# Altium schematic sheet 6.音频_FAN_ADC_LED.SchDoc
size 420 x 297 mm; SheetNumber: 6; SheetTotal: 13
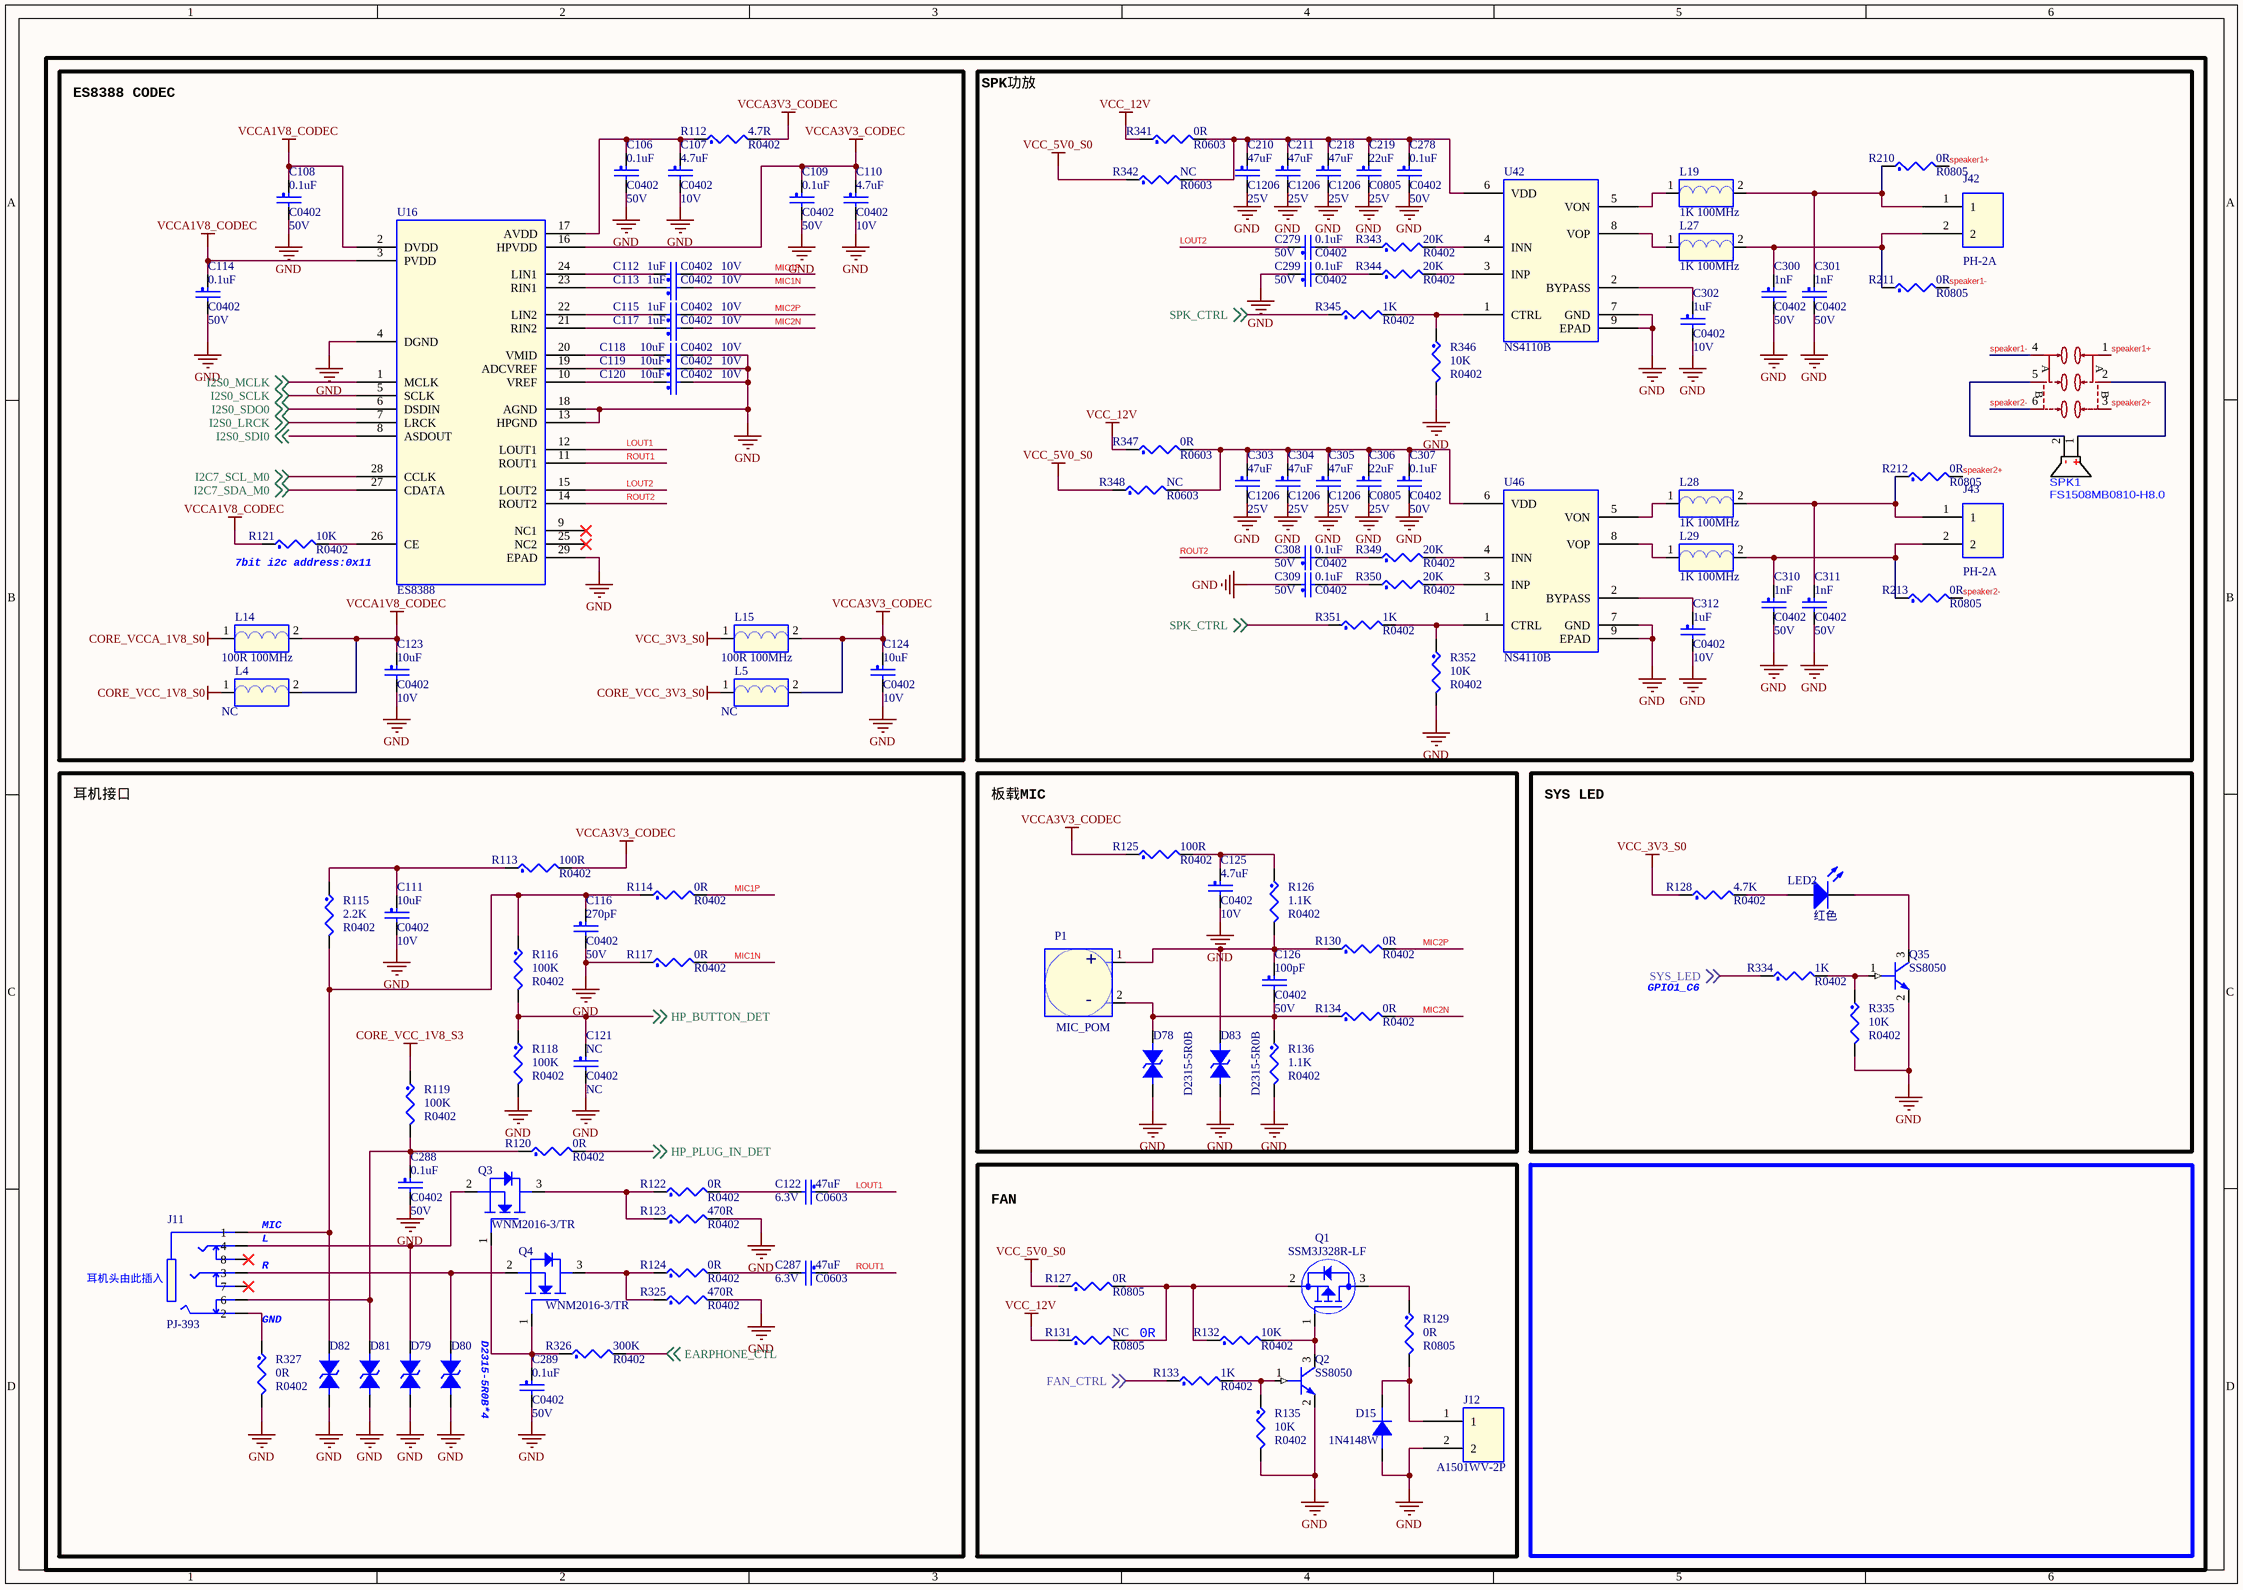
[diagram p0: 6.音频_FAN_ADC_LED.SchDoc]

## Parts
C106  0.1uF  Voltage: 50V  [C0402]
C107  4.7uF  Voltage: 10V  [C0402]
C108  0.1uF  Voltage: 50V  [C0402]
C109  0.1uF  Voltage: 50V  [C0402]
C110  4.7uF  Voltage: 10V  [C0402]
C111  10uF  Voltage: 10V  [C0402]
C112  1uF  Voltage: 10V  [C0402]
C113  1uF  Voltage: 10V  [C0402]
C114  0.1uF  Voltage: 50V  [C0402]
C115  1uF  Voltage: 10V  [C0402]
C116  270pF  Voltage: 50V  [C0402]
C117  1uF  Voltage: 10V  [C0402]
C118  10uF  Voltage: 10V  [C0402]
C119  10uF  Voltage: 10V  [C0402]
C120  10uF  Voltage: 10V  [C0402]
C121  NC  [C0402]
C122  47uF  Voltage: 6.3V  [C0603]
C123  10uF  Voltage: 10V  [C0402]
C124  10uF  Voltage: 10V  [C0402]
C125  4.7uF  Voltage: 10V  [C0402]
C126  100pF  Voltage: 50V  [C0402]
C210  47uF  Voltage: 25V  [C1206]
C211  47uF  Voltage: 25V  [C1206]
C218  47uF  Voltage: 25V  [C1206]
C219  22uF  Voltage: 25V  [C0805]
C278  0.1uF  Voltage: 50V  [C0402]
C279  0.1uF  Voltage: 50V  [C0402]
C287  47uF  Voltage: 6.3V  [C0603]
C288  0.1uF  Voltage: 50V  [C0402]
C289  0.1uF  Voltage: 50V  [C0402]
C299  0.1uF  Voltage: 50V  [C0402]
C300  1nF  Voltage: 50V  [C0402]
C301  1nF  Voltage: 50V  [C0402]
C302  1uF  Voltage: 10V  [C0402]
C303  47uF  Voltage: 25V  [C1206]
C304  47uF  Voltage: 25V  [C1206]
C305  47uF  Voltage: 25V  [C1206]
C306  22uF  Voltage: 25V  [C0805]
C307  0.1uF  Voltage: 50V  [C0402]
C308  0.1uF  Voltage: 50V  [C0402]
C309  0.1uF  Voltage: 50V  [C0402]
C310  1nF  Voltage: 50V  [C0402]
C311  1nF  Voltage: 50V  [C0402]
C312  1uF  Voltage: 10V  [C0402]
D15  1N4148W  [SOD-123]
D78  D2315-5R0B  [esd0402]
D79  D2315-5R0B  [esd0402]  (value not drawn)
D80  D2315-5R0B  [esd0402]  (value not drawn)
D81  D2315-5R0B  [esd0402]  (value not drawn)
D82  D2315-5R0B  [esd0402]  (value not drawn)
D83  D2315-5R0B  [esd0402]
J11  PJ-393  [audio_smd_7p_6r0x8r8]
J12  A1501WV-2P  [zh1p5mm_th_2p]
J42  PH-2A  [PH-1x2-2P0_l]
J43  PH-2A  [PH-1x2-2P0_l]
L4  NC  [L0603]
L5  NC  [L0603]
L14  100R 100MHz  [L0603]
L15  100R 100MHz  [L0603]
L19  1K 100MHz  [L0603]
L27  1K 100MHz  [L0603]
L28  1K 100MHz  [L0603]
L29  1K 100MHz  [L0603]
LED2  红色  [LED0603_R]
P1  MIC_POM  [MIC2-4R00-TM]
Q1  SSM3J328R-LF  [SOT23]
Q2  SS8050  [SOT23]
Q3  WNM2016-3/TR  [SOT23]
Q4  WNM2016-3/TR  [SOT23]
Q35  SS8050  [SOT23]
R112  4.7R  [R0402]
R113  100R  [R0402]
R114  0R  [R0402]
R115  2.2K  [R0402]
R116  100K  [R0402]
R117  0R  [R0402]
R118  100K  [R0402]
R119  100K  [R0402]
R120  0R  [R0402]
R121  10K  [R0402]
R122  0R  [R0402]
R123  470R  [R0402]
R124  0R  [R0402]
R125  100R  [R0402]
R126  1.1K  [R0402]
R127  0R  [R0805]
R128  4.7K  [R0402]
R129  0R  [R0805]
R130  0R  [R0402]
R131  NC  [R0805]
R132  10K  [R0402]
R133  1K  [R0402]
R134  0R  [R0402]
R135  10K  [R0402]
R136  1.1K  [R0402]
R210  0R  [R0805]
R211  0R  [R0805]
R212  0R  [R0805]
R213  0R  [R0805]
R325  470R  [R0402]
R326  300K  [R0402]
R327  0R  [R0402]
R334  1K  [R0402]
R335  10K  [R0402]
R341  0R  [R0603]
R342  NC  [R0603]
R343  20K  [R0402]
R344  20K  [R0402]
R345  1K  [R0402]
R346  10K  [R0402]
R347  0R  [R0603]
R348  NC  [R0603]
R349  20K  [R0402]
R350  20K  [R0402]
R351  1K  [R0402]
R352  10K  [R0402]
SPK1  FS1508MB0810-H8.0  [BEEP-TH_BD15.0-P10.20-D1.2]
SW5  MST22D18G2  [SW-SMD_MST22D18G2]  (value not drawn)
U16  ES8388  [qfn28_0r45-4x4EP2R6X2R6]
U42  NS4110B  [SOP-8-EP-2R5X3R4]
U46  NS4110B  [SOP-8-EP-2R5X3R4]

## Blocks framed on the sheet
ES8388 CODEC: C106-C110 C112-C115 C117-C120 C123 C124 L4 L5 L14 L15 R112 R121 U16
SPK功放: C210 C211 C218 C219 C278 C279 C299-C312 J42 J43 L19 L27-L29 R210-R213 R341-R352 SPK1 SW5 U42 U46
耳机接口: C111 C116 C121 C122 C287-C289 D79-D82 J11 Q3 Q4 R113-R120 R122-R124 R325-R327
板载MIC: C125 C126 D78 D83 P1 R125 R126 R130 R134 R136
SYS LED: LED2 Q35 R128 R334 R335
FAN: D15 J12 Q1 Q2 R127 R129 R131-R133 R135

## Nets
CORE_VCC_1V8_S0: L4.1
CORE_VCC_1V8_S3: R119.1
CORE_VCC_3V3_S0: L5.1
CORE_VCCA_1V8_S0: L14.1
GND: C106.2 C107.2 C108.2 C109.2 C110.2 C111.2 C114.2 C116.2 C118.2 C119.2 C120.2 C121.2 C123.2 C124.2 C125.2 C210.2 C211.2 C218.2 C219.2 C278.2 C288.2 C289.2 C299.1 C300.2 C301.2 C302.2 C303.2 C304.2 C305.2 C306.2 C307.2 C309.1 C310.2 C311.2 C312.2 D15.2(A) D78.1 D79.1 D80.1 D81.1 D82.1 D83.1 J12.2 Q2.2(EMITTER) Q35.2(EMITTER) R117.1 R118.2 R123.2 R135.2 R136.2 R325.2 R327.2 R335.2 R346.2 R352.2 U16.4(DGND) U16.13(HPGND) U16.18(AGND) U16.29(EPAD) U42.7(GND) U42.9(EPAD) U46.7(GND) U46.9(EPAD)
VCC_3V3_S0: L15.1 R128.1
VCC_5V0_S0: R127.1 R342.1 R348.1
VCC_12V: R131.1 R341.1 R347.1
VCCA1V8_CODEC: C108.1 C114.1 C123.1 L4.2 L14.2 R121.1 U16.2(DVDD) U16.3(PVDD)
VCCA3V3_CODEC: C109.1 C110.1 C124.1 L5.2 L15.2 R112.2 R113.2 R125.1 U16.16(HPVDD)
EARPHONE_CTL: R326.2 ; off-sheet EARPHONE_CTL
FAN_CTRL: R133.1 ; off-sheet FAN_CTRL
HP_BUTTON_DET: C121.1 R116.2 R118.1 ; off-sheet HP_BUTTON_DET
HP_PLUG_IN_DET: R120.2 ; off-sheet HP_PLUG_IN_DET
I2C7_SCL_M0: U16.28(CCLK) ; off-sheet I2C7_SCL_M0
I2C7_SDA_M0: U16.27(CDATA) ; off-sheet I2C7_SDA_M0
I2S0_LRCK: U16.7(LRCK) ; off-sheet I2S0_LRCK
I2S0_MCLK: U16.1(MCLK) ; off-sheet I2S0_MCLK
I2S0_SCLK: U16.5(SCLK) ; off-sheet I2S0_SCLK
I2S0_SDI0: U16.8(ASDOUT) ; off-sheet I2S0_SDI0
I2S0_SDO0: U16.6(DSDIN) ; off-sheet I2S0_SDO0
LOUT1: C122.1 U16.12(LOUT1)
LOUT2: C279.1 U16.15(LOUT2)
MIC1N: C113.2 R117.2
MIC1P: C112.2 R114.2
MIC2N: C117.2 R134.2
MIC2P: C115.2 R130.2
ROUT1: C287.1 U16.11(ROUT1)
ROUT2: C308.1 U16.14(ROUT2)
speaker1+: R210.2 SW5.1
speaker1-: R211.2 SW5.4
speaker2+: R212.2 SW5.3
speaker2-: R213.2 SW5.6
SPK_CTRL: R345.1 R351.1 ; off-sheet SPK_CTRL
SYS_LED: R334.1 ; off-sheet SYS_LED
NetC106_1: C106.1 C107.1 R112.1 U16.17(AVDD)
NetC111_1: C111.1 R113.1 R115.1
NetC112_1: C112.1 U16.24(LIN1)
NetC113_1: C113.1 U16.23(RIN1)
NetC115_1: C115.1 U16.22(LIN2)
NetC116_1: C116.1 D82.2 J11.1 R114.1 R115.2 R116.1
NetC117_1: C117.1 U16.21(RIN2)
NetC118_1: C118.1 U16.20(VMID)
NetC119_1: C119.1 U16.19(ADCVREF)
NetC120_1: C120.1 U16.10(VREF)
NetC122_2: C122.2 R122.2
NetC125_1: C125.1 R125.2 R126.1
NetC126_1: C126.1 D83.2 P1.1(Out) R126.2 R130.1
NetC126_2: C126.2 D78.2 P1.2(GND) R134.1 R136.1
NetC210_1: C210.1 C211.1 C218.1 C219.1 C278.1 R341.2 R342.2 U42.6(VDD)
NetC279_2: C279.2 R343.1
NetC287_2: C287.2 R124.2
NetC288_1: C288.1 D81.2 J11.6 R119.2 R120.1
NetC289_1: C289.1 Q3.1(GATE) Q4.1(GATE) R326.1
NetC299_2: C299.2 R344.1
NetC300_1: C300.1 J42.2 L27.2 R211.1
NetC301_1: C301.1 J42.1 L19.2 R210.1
NetC302_1: C302.1 U42.2(BYPASS)
NetC303_1: C303.1 C304.1 C305.1 C306.1 C307.1 R347.2 R348.2 U46.6(VDD)
NetC308_2: C308.2 R349.1
NetC309_2: C309.2 R350.1
NetC310_1: C310.1 J43.2 L29.2 R213.1
NetC311_1: C311.1 J43.1 L28.2 R212.1
NetC312_1: C312.1 U46.2(BYPASS)
NetD15_1: D15.1(K) J12.1 R129.2
NetD79_2: D79.2 J11.4 Q3.2(SOURCE)
NetD80_2: D80.2 J11.3 Q4.2(SOURCE)
NetJ11_2: J11.2 R327.1
NetL19_1: L19.1 U42.5(VON)
NetL27_1: L27.1 U42.8(VOP)
NetL28_1: L28.1 U46.5(VON)
NetL29_1: L29.1 U46.8(VOP)
NetLED2_1: LED2.1(A) R128.2
NetLED2_2: LED2.2(K) Q35.3(COLLECTOR)
NetQ1_1: Q1.1(GATE) Q2.3(COLLECTOR) R132.2
NetQ1_2: Q1.2(SOURCE) R127.2 R131.2 R132.1
NetQ1_3: Q1.3(DRAIN) R129.1
NetQ2_1: Q2.1(BASE) R133.2 R135.1
NetQ3_3: Q3.3(DRAIN) R122.1 R123.1
NetQ4_3: Q4.3(DRAIN) R124.1 R325.1
NetQ35_1: Q35.1(BASE) R334.2 R335.1
NetR121_2: R121.2 U16.26(CE)
NetR343_2: R343.2 U42.4(INN)
NetR344_2: R344.2 U42.3(INP)
NetR345_2: R345.2 R346.1 U42.1(CTRL)
NetR349_2: R349.2 U46.4(INN)
NetR350_2: R350.2 U46.3(INP)
NetR351_2: R351.2 R352.1 U46.1(CTRL)
NetSPK1_1: SPK1.1 SW5.2
NetSPK1_2: SPK1.2 SW5.5

Not connected (* = marked no-connect by the designer): J11 7* 8*; U16 9(NC1)* 25(NC2)*

## Notes on the sheet
- (near R121) 7bit i2c address:0x11
- GPIO1_C6
- (near J11) MIC
- (near J11) R
- (near J11) L
- 耳机头由此插入
- GND
- D2315-5R0B*4
- (near R131) 0R
- (in symbol MIC_POM) +; -
- (in symbol MST22D18G2) A; B

## Library data of the parts
C106 C108 C109 C114 C289 C299 C307 C308 = CAP_NP: CLASS: DISCRETE; 规格: 贴片电容0.1uF 10% 50V X5R 0402; 规格编号: 0402X104K500NT; 条码: EBF29060118; 品牌: 风华; 类别: 贴片电容0402; 规格书: 风华电容.pdf; 价格: 0.029826; 生命周期: 量产; PCB Footprint: C0402
C107 C110 = CAP_NP: CLASS: DISCRETE; 生命周期: 量产; 价格: 0.059058; 规格书: 国巨-贴片电容.pdf; 类别: 贴片电容0402; 品牌: 国巨; 条码: EBF29060248; 规格编号: CC0402KRX5R6BB475; 规格: 贴片电容4.7uF 10% 10V X5R 0402; PCB Footprint: C0402
C111 C118-C120 = CAP_NP: CLASS: DISCRETE; 规格: 贴片电容10uF 20% 10V X5R 0402; 规格编号: CL05A106MP8NUB8; 条码: EBF29060247; 品牌: 三星; 类别: 贴片电容0402; 规格书: 三星电容.pdf; 价格: 0.518415; 生命周期: 量产; PCB Footprint: C0402
C112 C113 C115 C117 C312 = CAP_NP: CLASS: DISCRETE; 生命周期: 量产; 价格: 0.01191; 规格书: 风华电容.pdf; 类别: 贴片电容0402; 品牌: 风华; 条码: EBF29060121; 规格编号: 0402X105K100NT; 规格: 贴片电容1uF 10% 10V X5R 0402; PCB Footprint: C0402
C116 = CAP_NP: CLASS: DISCRETE; 规格: 贴片电容270pF 5% 50V C0G 0402; 规格编号: 0402CG271J500NT; 条码: EBF29060290; 品牌: 风华; 类别: 贴片电容0402; 规格书: 风华电容.pdf; 价格: 0.018204; 生命周期: 量产; PCB Footprint: C0402
C121 = CAP_NP: CLASS: DISCRETE; 规格: 贴片电容NC 预留; 条码: EBF29060149; 类别: 贴片电容0402; Voltage: NC; PCB Footprint: C0402
C122 C287 = CAP_NP: CLASS: DISCRETE; 规格: 贴片电容47uF 20% 6.3V X5R 0603; 规格编号: CL10A476MQ8QRNC; 条码: EBF29060263; 品牌: 三星; 类别: 贴片电容0603; 规格书: 三星电容.pdf; 价格: 0.420524; 生命周期: 量产; PCB Footprint: C0603
C123 C124 = CAP_NP: CLASS: DISCRETE; 生命周期: 量产; 价格: 0.518415; 规格书: 三星电容.pdf; 类别: 贴片电容0402; 品牌: 三星; 条码: EBF29060247; 规格编号: CL05A106MP8NUB8; 规格: 贴片电容10uF 20% 10V X5R 0402; PCB Footprint: C0402
C125 = CAP_NP: CLASS: DISCRETE; 规格: 贴片电容4.7uF 10% 10V X5R 0402; 规格编号: CC0402KRX5R6BB475; 条码: EBF29060248; 品牌: 国巨; 类别: 贴片电容0402; 规格书: 国巨-贴片电容.pdf; 价格: 0.059058; 生命周期: 量产; PCB Footprint: C0402
C126 = CAP_NP: CLASS: DISCRETE; 生命周期: 量产; 价格: 0.034837; 规格书: 村田040系列贴片电容.pdf; 类别: 贴片电容0402; 品牌: 村田; 条码: EBF29060302; 规格编号: GRT1555C1H101JA; 规格: 贴片电容100pF 5% 50V C0G 0402; PCB Footprint: C0402
C210 C211 C218 = CAP_NP: CLASS: DISCRETE; 规格: 贴片电容47uF 20% 25V X5R 1206; 规格编号: GRM31CR61E476ME44L; 条码: EBF29060192; 品牌: 村田; 类别: 贴片电容1206; 规格书: 村田贴片电容.pdf; 价格: 1.12; 生命周期: 量产; PCB Footprint: C1206
C219 C306 = CAP_NP: CLASS: DISCRETE; 规格: 贴片电容22uF 20% 25V X5R 0805; 规格编号: 0805X226M250NT; 条码: EBF29060173; 品牌: 风华; 类别: 贴片电容0805; 规格书: 风华电容.pdf; 价格: 0.285631; 生命周期: 量产; PCB Footprint: C0805
C278 C279 C288 C309 = CAP_NP: CLASS: DISCRETE; 生命周期: 量产; 价格: 0.029826; 规格书: 风华电容.pdf; 类别: 贴片电容0402; 品牌: 风华; 条码: EBF29060118; 规格编号: 0402X104K500NT; 规格: 贴片电容0.1uF 10% 50V X5R 0402; PCB Footprint: C0402
C300 C301 = CAP_NP: CLASS: DISCRETE; 规格: 贴片电容1nF 20% 50V X7R 0402; 规格编号: 0402B102M500NT; 条码: EBF29060175; 品牌: 风华; 类别: 贴片电容0402; 规格书: 风华电容.pdf; 价格: 0.006195; 生命周期: 量产; PCB Footprint: C0402
C302 = CAP_NP: CLASS: DISCRETE; 规格: 贴片电容1uF 10% 10V X5R 0402; 规格编号: 0402X105K100NT; 条码: EBF29060121; 品牌: 风华; 类别: 贴片电容0402; 规格书: 风华电容.pdf; 价格: 0.01191; 生命周期: 量产; PCB Footprint: C0402
C303-C305 = CAP_NP: CLASS: DISCRETE; 生命周期: 量产; 价格: 1.12; 规格书: 村田贴片电容.pdf; 类别: 贴片电容1206; 品牌: 村田; 条码: EBF29060192; 规格编号: GRM31CR61E476ME44L; 规格: 贴片电容47uF 20% 25V X5R 1206; PCB Footprint: C1206
C310 C311 = CAP_NP: CLASS: DISCRETE; 生命周期: 量产; 价格: 0.006195; 规格书: 风华电容.pdf; 类别: 贴片电容0402; 品牌: 风华; 条码: EBF29060175; 规格编号: 0402B102M500NT; 规格: 贴片电容1nF 20% 50V X7R 0402; PCB Footprint: C0402
D15 = DIODE: 丝印: T4; 生命周期: 量产; 价格: 0.061637; 规格书: 1N4148WT4.pdf; 类别: 贴片开关二极管; 品牌: 江苏长电; 条码: EBF29140015; 规格: 开关二极管 反向耐压值100V 平均整流电流150mA 正向压降1.25V 150mA 功率500mW; 规格编号: 1N4148W; PCB Footprint: SOD-123
D78 D80 D83 = DIODE BI-DIR TRIG: 规格: 防静电保护ESD二极管 反向工作电压5V 击穿电压7V 钳位电压10.5V 结电容Cj 0.3pF; 条码: EBFCIS240517170922; 品牌: 千虹; 类别: 贴片ESD; 规格书: 千虹_D2315-5R0B.pdf; 生命周期: 量产; 备注: 通用; PCB Footprint: esd0402; 规格编号: D2315-5R0B
D79 D81 D82 = DIODE BI-DIR TRIG: 备注: 通用; 生命周期: 量产; 规格书: 千虹_D2315-5R0B.pdf; 类别: 贴片ESD; 品牌: 千虹; 条码: EBFCIS240517170922; 规格: 防静电保护ESD二极管 反向工作电压5V 击穿电压7V 钳位电压10.5V 结电容Cj 0.3pF; PCB Footprint: esd0402; 规格编号: D2315-5R0B
J11 = PJ-393: 规格: PJ-393_3.5MM四段式耳机插座_7pin; 条码: EBF29040116; 类别: 耳机座; 规格书: PJ-393_3.5MM四段式耳机插座_7pin.pdf; 生命周期: 量产; 品牌: 品赞; PCB Footprint: audio_smd_7p_6r0x8r8; 规格编号: PJ-393
J12 = 1X2PIN: 生命周期: 量产; 规格书: 长江连接器_A1501WV-2P.PDF; 类别: 线对板连接器; 品牌: 长江连接器; 条码: EBF29040095; 规格: ZH1.5直插 镀锡 2P 针座连接器; PCB Footprint: zh1p5mm_th_2p; 规格编号: A1501WV-2P
J42 J43 = 1X2PIN: 可替代料: EBF29040005; 生命周期: 量产; 价格: 0.019031; 规格书: 博穆精密_PH2.0-A.pdf; 类别: PH连接器; 品牌: 博穆精密; 规格: 直针PH2.0-2P 间距2.0MM 拔插式 接插件; PCB Footprint: PH-1x2-2P0_l; 条码: EBF29040005; 规格编号: PH-2A
L4 L5 L14 = BEAD: CLASS: DISCRETE; 生命周期: 量产; 价格: 0.021567; 规格书: 顺络-磁珠.pdf; 类别: 贴片磁珠0603; 品牌: 顺络; 条码: EBF29050038; 规格编号: UPZ1608E101-3R0TF; 规格: 磁珠100Ω @100MHz 额定电流3A 直流电阻30mΩ; PCB Footprint: L0603
L15 = BEAD: CLASS: DISCRETE; 规格: 磁珠100Ω @100MHz 额定电流3A 直流电阻30mΩ; 规格编号: UPZ1608E101-3R0TF; 条码: EBF29050038; 品牌: 顺络; 类别: 贴片磁珠0603; 规格书: 顺络-磁珠.pdf; 价格: 0.021567; 生命周期: 量产; PCB Footprint: L0603
L19 L27 = BEAD: CLASS: DISCRETE; 规格: 磁珠1K@100MHz额定电流600mA直流电阻350mΩ; 规格编号: BLM18HE102SN1D; 条码: EBFCIS230428095012; 品牌: 村田; 类别: 贴片磁珠0603; 规格书: 村田_BLM18H_SN系列磁珠.pdf; 价格: 0.149038; 生命周期: 量产; 备注: RK3566广告机; PCB Footprint: L0603
L28 L29 = BEAD: CLASS: DISCRETE; 生命周期: 量产; 价格: 0.149038; 规格书: 村田_BLM18H_SN系列磁珠.pdf; 类别: 贴片磁珠0603; 品牌: 村田; 条码: EBFCIS230428095012; 规格编号: BLM18HE102SN1D; 规格: 磁珠1K@100MHz额定电流600mA直流电阻350mΩ; 备注: RK3566广告机; PCB Footprint: L0603
LED2 = LED: 贴片LED; 封装库来自淘宝卖家：黄晶宝石: 其他店铺购入均为盗版封装库，无更新权益，请立即申请退款，本店现金奖励200~1000元; BOM名称: 贴片LED
P1 = MIC_POM: CLASS: IC; 规格: 4*1.2mm咪头 双电容驻极体话筒 拾音器 工作电压1.5V-10V 灵敏度-62DB 低阻抗; 规格编号: GMI4015P-2C-62db; 条码: EBFCIS221130183008; 品牌: 赢海; 类别: 麦克风; 规格书: 赢海_GMI4015P-2C-62db.pdf; 价格: 0.868384; 生命周期: 量产; PCB Footprint: MIC2-4R00-TM
Q1 = MOSFET_P: CLASS: IC; 规格: P沟道MOS 导通电阻29.8mΩ 电流3A 1.5V可驱动; 规格编号: SSM3J328R LF; 条码: EBF29280008; 品牌: 东芝; 类别: P-MOS; 规格书: SSM3J328R-LF.pdf; 价格: 0.447836; 生命周期: 量产; 丝印: KFH-XXX; PCB Footprint: SOT23
Q2 Q35 = NPN: CLASS: IC; 规格: 贴片三极管SS8050 集电极电流1.5A 额定功率300mW NPN; 条码: EBF29090001; 品牌: 江苏长电; 类别: 贴片三极管SOT-23; 规格书: 江苏长电-SS8050Y1.pdf; 价格: 0.086744; 生命周期: 量产; 丝印: Y1; 规格编号: SS8050; PCB Footprint: SOT23
Q3 = MOSFET N: 规格: N沟道MOS 导通电阻47mΩ 电流3.6A 4.5V 阈值电压(Vgs(th)@Id)1V 连续漏极电流2.9A; 条码: EBF29280014; 品牌: 韦尔; 类别: N-MOS; 规格书: WNM2016-3_TR.pdf; 备注: 立创停售; PCB Footprint: SOT23; 规格编号: WNM2016-3/TR
Q4 = MOSFET N: 备注: 立创停售; 规格书: WNM2016-3_TR.pdf; 类别: N-MOS; 品牌: 韦尔; 条码: EBF29280014; 规格: N沟道MOS 导通电阻47mΩ 电流3.6A 4.5V 阈值电压(Vgs(th)@Id)1V 连续漏极电流2.9A; PCB Footprint: SOT23; 规格编号: WNM2016-3/TR
R112 = RES: CLASS: DISCRETE; 规格: 贴片电阻4.7R 1% 1/16W 0402; 规格编号: 0402WGF470KTCE; 条码: EBFCIS221112135607; 品牌: 厚声; 类别: 贴片电阻0402; 规格书: 厚声-无铅厚膜电阻.pdf; 价格: 0.003317; 生命周期: 量产; PCB Footprint: R0402
R113 = RES: CLASS: DISCRETE; 规格: 贴片电阻100R 1% 1/16W 0402; 规格编号: RI0402L1000FT; 条码: EBF29070053; 品牌: 合科泰; 类别: 贴片电阻0402; 规格书: 合科泰-RI系列电阻.pdf; 生命周期: 量产; PCB Footprint: R0402
R114 R117 R120 R122 R124 R130 R327 = RES: CLASS: DISCRETE; 生命周期: 量产; 规格书: 合科泰-RI系列电阻.pdf; 类别: 贴片电阻0402; 品牌: 合科泰; 条码: EBF29070049; 规格编号: RI0402L000FT; 规格: 贴片电阻0R 1% 1/16W 0402; PCB Footprint: R0402
R115 = RES: CLASS: DISCRETE; 规格: 贴片电阻2.2K 1% 1/16W 0402; 规格编号: RI0402L2201FT; 条码: EBF29070051; 品牌: 合科泰; 类别: 贴片电阻0402; 规格书: 合科泰-RI系列电阻.pdf; 生命周期: 量产; PCB Footprint: R0402
R116 R118 = RES: CLASS: DISCRETE; 生命周期: 量产; 规格书: 合科泰-RI系列电阻.pdf; 类别: 贴片电阻0402; 品牌: 合科泰; 条码: EBF29070054; 规格编号: RI0402L1003FT; 规格: 贴片电阻100K 1% 1/16W 0402; PCB Footprint: R0402
R119 = RES: CLASS: DISCRETE; 规格: 贴片电阻100K 1% 1/16W 0402; 规格编号: RI0402L1003FT; 条码: EBF29070054; 品牌: 合科泰; 类别: 贴片电阻0402; 规格书: 合科泰-RI系列电阻.pdf; 生命周期: 量产; PCB Footprint: R0402
R121 R346 = RES: CLASS: DISCRETE; 生命周期: 量产; 价格: 0.002773; 规格书: 厚声-无铅厚膜电阻.pdf; 类别: 贴片电阻0402; 品牌: 厚声; 条码: EBF29070046; 规格编号: 0402WGF1002TCE; 规格: 贴片电阻10K 1% 1/16W 0402; PCB Footprint: R0402
R123 R325 = RES: CLASS: DISCRETE; 规格: 贴片电阻470R 1% 1/16W 0402; 规格编号: 0402WGF4700TCE; 条码: EBF29070284; 品牌: 厚声; 类别: 贴片电阻0402; 规格书: 厚声-无铅厚膜电阻.pdf; 价格: 0.002728; 生命周期: 量产; PCB Footprint: R0402
R125 = RES: CLASS: DISCRETE; 生命周期: 量产; 规格书: 合科泰-RI系列电阻.pdf; 类别: 贴片电阻0402; 品牌: 合科泰; 条码: EBF29070053; 规格编号: RI0402L1000FT; 规格: 贴片电阻100R 1% 1/16W 0402; PCB Footprint: R0402
R126 R136 = RES: CLASS: DISCRETE; 规格: 贴片电阻1.1K 1% 1/16W 0402; 规格编号: 0402WGF1101TCE; 条码: EBFCIS221112135212; 品牌: 厚声; 类别: 贴片电阻0402; 规格书: 厚声-无铅厚膜电阻.pdf; 价格: 0.001622; 生命周期: 量产; PCB Footprint: R0402
R127 R210-R213 = RES: CLASS: DISCRETE; 生命周期: 量产; 规格书: 合科泰-RI系列电阻.pdf; 类别: 贴片电阻0805; 品牌: 合科泰; 条码: EBF29070064; 规格编号: RI0805L0000FT; 规格: 贴片电阻0R 1% 1/8W 0805; PCB Footprint: R0805
R128 = RES: CLASS: DISCRETE; 生命周期: 量产; 规格书: 合科泰-RI系列电阻.pdf; 类别: 贴片电阻0402; 品牌: 合科泰; 条码: EBF29070047; 规格编号: RI0402L4701FT; 规格: 贴片电阻4.7K 1% 1/16W 0402; PCB Footprint: R0402
R129 = RES: CLASS: DISCRETE; 规格: 贴片电阻0R 1% 1/8W 0805; 规格编号: RI0805L0000FT; 条码: EBF29070064; 品牌: 合科泰; 类别: 贴片电阻0805; 规格书: 合科泰-RI系列电阻.pdf; 生命周期: 量产; PCB Footprint: R0805
R131 = RES: CLASS: DISCRETE; 类别: 贴片电阻0805; 条码: EBF29070089; 规格: 贴片电阻NC 预留; PCB Footprint: R0805
R132 R135 R335 R352 = RES: CLASS: DISCRETE; 规格: 贴片电阻10K 1% 1/16W 0402; 规格编号: 0402WGF1002TCE; 条码: EBF29070046; 品牌: 厚声; 类别: 贴片电阻0402; 规格书: 厚声-无铅厚膜电阻.pdf; 价格: 0.002773; 生命周期: 量产; PCB Footprint: R0402
R133 R334 R345 = RES: CLASS: DISCRETE; 生命周期: 量产; 规格书: 合科泰-RI系列电阻.pdf; 类别: 贴片电阻0402; 品牌: 合科泰; 条码: EBF29070050; 规格编号: RI0402L1001FT; 规格: 贴片电阻1K 1% 1/16W 0402; PCB Footprint: R0402
R134 = RES: CLASS: DISCRETE; 规格: 贴片电阻0R 1% 1/16W 0402; 规格编号: RI0402L000FT; 条码: EBF29070049; 品牌: 合科泰; 类别: 贴片电阻0402; 规格书: 合科泰-RI系列电阻.pdf; 生命周期: 量产; PCB Footprint: R0402
R326 = RES: CLASS: DISCRETE; 规格: 贴片电阻300K 1% 1/16W 0402; 规格编号: RI0402L3003FT; 条码: EBF29070220; 品牌: 合科泰; 类别: 贴片电阻0402; 规格书: 合科泰-RI系列电阻.pdf; 生命周期: 量产; PCB Footprint: R0402
R341 R347 = RES: CLASS: DISCRETE; 生命周期: 量产; 规格书: 合科泰-RI系列电阻.pdf; 类别: 贴片电阻0603; 品牌: 合科泰; 条码: EBF29070063; 规格编号: RI0603L0000FT; 规格: 贴片电阻0R 1% 1/10W 0603; PCB Footprint: R0603
R342 R348 = RES: CLASS: DISCRETE; 类别: 贴片电阻0603; 条码: EBF29070088; 规格: 贴片电阻NC 预留; PCB Footprint: R0603
R343 R344 = RES: CLASS: DISCRETE; 规格: 贴片电阻20K 1% 1/16W 0402; 规格编号: 0402WGF2002TCE; 条码: EBF29070223; 品牌: 厚声; 类别: 贴片电阻0402; 规格书: 厚声-无铅厚膜电阻.pdf; 价格: 0.002473; 生命周期: 量产; PCB Footprint: R0402
R349 R350 = RES: CLASS: DISCRETE; 生命周期: 量产; 价格: 0.002473; 规格书: 厚声-无铅厚膜电阻.pdf; 类别: 贴片电阻0402; 品牌: 厚声; 条码: EBF29070223; 规格编号: 0402WGF2002TCE; 规格: 贴片电阻20K 1% 1/16W 0402; PCB Footprint: R0402
R351 = RES: CLASS: DISCRETE; 规格: 贴片电阻1K 1% 1/16W 0402; 规格编号: RI0402L1001FT; 条码: EBF29070050; 品牌: 合科泰; 类别: 贴片电阻0402; 规格书: 合科泰-RI系列电阻.pdf; 生命周期: 量产; PCB Footprint: R0402
SW5 = MST22D18G2: Manufacturer: SHOU HAN(首韩); Add into BOM: yes; Symbol: MST22D18G2; Device: MST22D18G2; LCSC Part Name: 两档立式贴片 6脚拨动 柄长2.0MM; Supplier Part: C431544; Manufacturer Part: MST22D18G2; Supplier Footprint: SMD,3.6x9.1mm; JLCPCB Part Class: 扩展库; Datasheet: https://atta.szlcsc.com/upload/public/pdf/source/20190925/C431544_D32DFFD935A96A6C5145903882D4ABA1.pdf; Supplier: LCSC; Convert to PCB: yes
U16 = ES8388: 价格: 3.904; 规格书: 顺芯_ES8388.pdf; 类别: 音频芯片; 品牌: 顺芯; 条码: EBFCIS221116105415; 规格: 音频接口芯片 模拟供电1.7V~3.6V 核心与IO供电1.5V~3.6V; 规格编号: ES8388; PCB Footprint: qfn28_0r45-4x4EP2R6X2R6
U42 U46 = NS4110B: 规格: 单声道AB/D类音频功率放大器 工作电压:6V~14V 输出功率:18W@4Ω 超低EMI 支持差分输入; 条码: EBFCIS230518164803; 品牌: 纳芯威; 类别: 音频芯片; 规格书: 纳芯威_NS4110B音频功放.pdf; 生命周期: 量产; 备注: RK3566广告机; 规格编号: NS4110B; PCB Footprint: SOP-8-EP-2R5X3R4